# Altium schematic sheet Top Level.SchDoc
size A; SheetNumber: 1; SheetTotal: 1
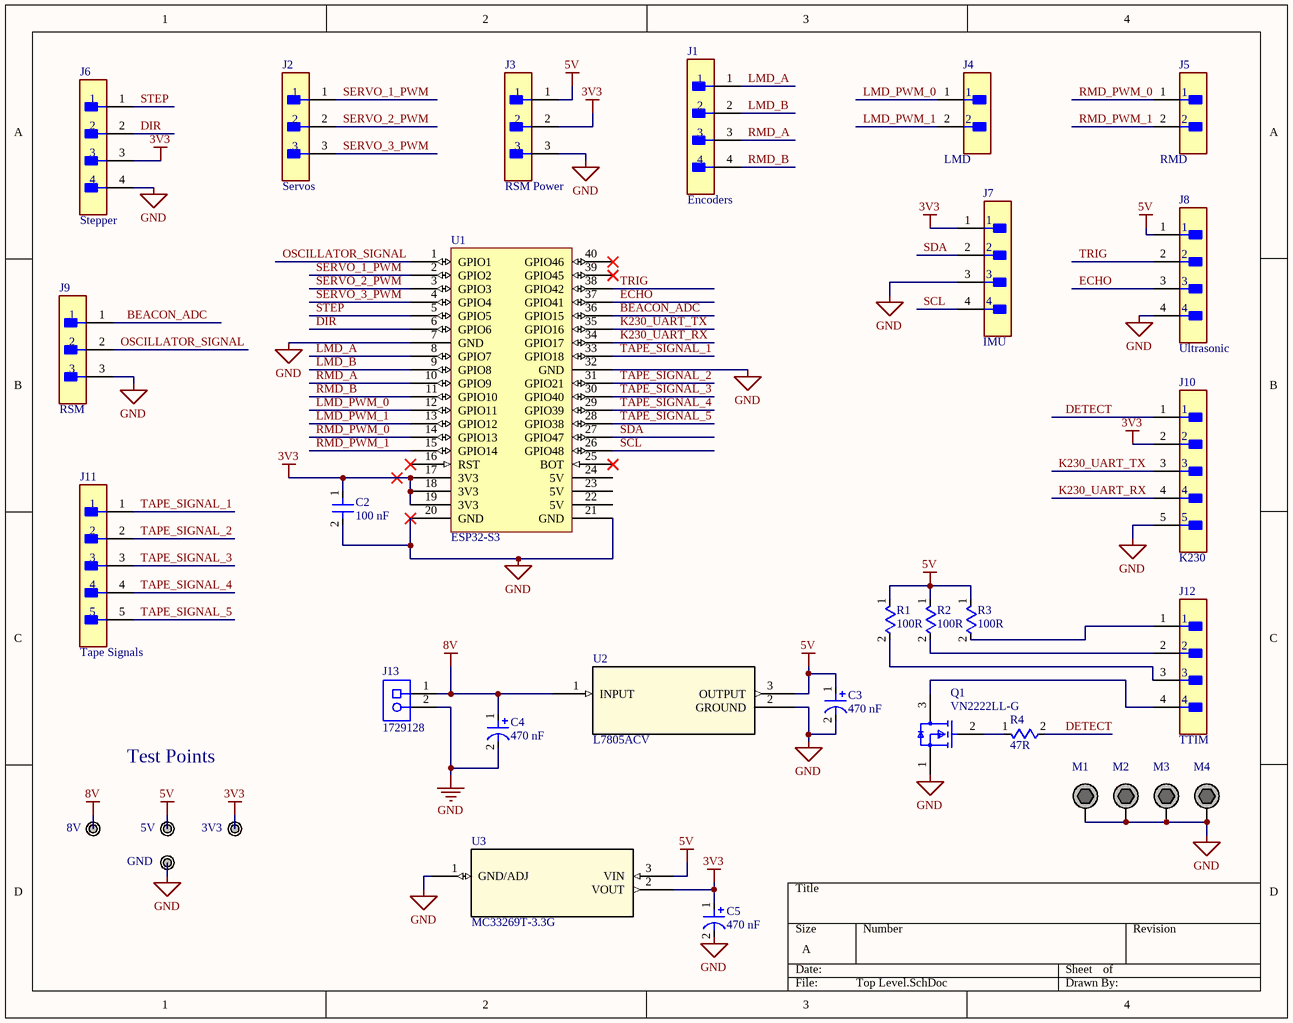
[diagram p0: Top Level.SchDoc]

## Parts
C2  100 nF  [Generic small capacitor]
C3  470 nF  [small electrolytic cap]
C4  470 nF  [small electrolytic cap]
C5  470 nF  [small electrolytic cap]
J1  Encoders  [FP-B4B-XH-A_LF_SN-MFG]
J2  Servos  [FP-B3B-XH-A_LF_SN-MFG]
J3  RSM Power  [FP-B3B-XH-A_LF_SN-MFG]
J4  LMD  [FP-B2B-XH-A_LF_SN-MFG]
J5  RMD  [FP-B2B-XH-A_LF_SN-MFG]
J6  Stepper  [FP-B4B-XH-A_LF_SN-MFG]
J7  IMU  [FP-B4B-XH-A_LF_SN-MFG]
J8  Ultrasonic  [FP-B4B-XH-A_LF_SN-MFG]
J9  RSM  [FP-B3B-XH-A_LF_SN-MFG]
J10  K230  [FP-B5B-XH-AM_LF_SN-MFG]
J11  Tape Signals  [FP-B5B-XH-AM_LF_SN-MFG]
J12  TTIM  [FP-B4B-XH-A_LF_SN-MFG]
J13  1729128  [PHOE-1729128-2_V]
M1  M3 Mounting Hole Plated  [M3 Screw Hole - Plated]  (value not drawn)  (no BOM)
M2  M3 Mounting Hole Plated  [M3 Screw Hole - Plated]  (value not drawn)  (no BOM)
M3  M3 Mounting Hole Plated  [M3 Screw Hole - Plated]  (value not drawn)  (no BOM)
M4  M3 Mounting Hole Plated  [M3 Screw Hole - Plated]  (value not drawn)  (no BOM)
Q1  VN2222LL-G  [FP-VN2222LL-G-MFG]
R1  100R  [Axial 0.5]
R2  100R  [Axial 0.5]
R3  100R  [Axial 0.5]
R4  47R  [Axial 0.5]
TP1  8V  [TESTPOINT]  (no BOM)
TP2  5V  [TESTPOINT]  (no BOM)
TP3  3V3  [TESTPOINT]  (no BOM)
TP4  GND  [TESTPOINT]  (no BOM)
U1  ESP32-S3  [esp32]
U2  L7805ACV  [TO-220_STM]
U3  MC33269T-3.3G  [MC33269T-33]

## Nets
3V3: C2.1 C5.1 J3.2 J6.3 J7.1 J10.2 TP3.1(TP) U1.17(3V3) U1.18(3V3) U1.19(3V3) U3.2(VOUT)
5V: C3.1 J3.1 J8.1 R1.1 R2.1 R3.1 TP2.1(TP) U2.3(OUTPUT) U3.3(VIN)
8V: C4.1 J13.1 TP1.1(TP) U2.1(INPUT)
GND: C2.2 C3.2 C4.2 C5.2 J3.3 J6.4 J7.3 J8.4 J9.3 J10.5 J13.2 M1.1 M2.1 M3.1 M4.1 Q1.1(SOURCE) TP4.1(TP) U1.7(GND) U1.20(GND) U1.21(GND) U1.32(GND) U2.2(GROUND) U3.1(GND/ADJ)
BEACON_ADC: J9.1 U1.36(GPIO15)
DETECT: J10.1 R4.2
DIR: J6.2 U1.6(GPIO6)
ECHO: J8.3 U1.37(GPIO41)
K230_UART_RX: J10.4 U1.34(GPIO17)
K230_UART_TX: J10.3 U1.35(GPIO16)
LMD_A: J1.1 U1.8(GPIO7)
LMD_B: J1.2 U1.9(GPIO8)
LMD_PWM_0: J4.1 U1.12(GPIO11)
LMD_PWM_1: J4.2 U1.13(GPIO12)
OSCILLATOR_SIGNAL: J9.2 U1.1(GPIO1)
RMD_A: J1.3 U1.10(GPIO9)
RMD_B: J1.4 U1.11(GPIO10)
RMD_PWM_0: J5.1 U1.14(GPIO13)
RMD_PWM_1: J5.2 U1.15(GPIO14)
SCL: J7.4 U1.26(GPIO48)
SDA: J7.2 U1.27(GPIO47)
SERVO_1_PWM: J2.1 U1.2(GPIO2)
SERVO_2_PWM: J2.2 U1.3(GPIO3)
SERVO_3_PWM: J2.3 U1.4(GPIO4)
STEP: J6.1 U1.5(GPIO5)
TAPE_SIGNAL_1: J11.1 U1.33(GPIO18)
TAPE_SIGNAL_2: J11.2 U1.31(GPIO21)
TAPE_SIGNAL_3: J11.3 U1.30(GPIO40)
TAPE_SIGNAL_4: J11.4 U1.29(GPIO39)
TAPE_SIGNAL_5: J11.5 U1.28(GPIO38)
TRIG: J8.2 U1.38(GPIO42)
NetJ12_1: J12.1 R3.2
NetJ12_2: J12.2 R2.2
NetJ12_3: J12.3 R1.2
NetJ12_4: J12.4 Q1.3(DRAIN)
NetQ1_2: Q1.2(GATE) R4.1

Not connected (* = marked no-connect by the designer): U1 16(RST)* 22(5V) 23(5V) 24(5V) 25(BOT)* 39(GPIO45)* 40(GPIO46)*

## Notes on the sheet
- Test Points

## Library data of the parts
C2 = CAP_GENERIC
C3-C5 = electrolytic cap
J1 J6-J8 J12 = CMP-17439-000250-1: CONN HEADER VERT 4POS 2.5MM; Number of Contacts: 4; Contact Resistance: 20mR; Voltage Rating: 250V; Max Current Rating: 3A; Gender: Male; Wire/Cable Gauge: 22AWG; Mated Stacking Heights: 9.8mm; Insulation Resistance: 1GR; Orientation: Straight; Contact Type: Male Pin; Contact Finish - Mating: TIN; Series: XH; Max Voltage Rating (AC): 250V; Lead Pitch: 2.5mm; Contact Shape: Square; Insulation Color: Natural; Termination: Solder; Lead Free: Lead Free; Voltage Rating (AC): 250V; Number of Rows: 1; Flammability Rating: UL94 V-0; Number of Positions: 4; Max Operating Temperature: 85°C; Package Quantity: 500; Mount: Through Hole; REACH SVHC: No SVHC; Connector Type: Header; Insulation Material: Nylon; Fastening Type: Detent; Min Operating Temperature: -25°C; Housing Color: White; Packaging: Bulk; Contact Plating: Tin; Contact Material: Brass; Max Voltage Rating (DC): 250V; Housing Material: Polyamide; Color: Natural; Material: Polyamide; Pitch: 2.5mm; Depth: 5.75mm; Current Rating: 3A; Length: 12.4mm
J2 J3 J9 = CMP-17439-000014-3: CONN HEADER VERT 3POS 2.5MM; Max Voltage Rating (DC): 250V; Number of Positions: 3; Current Rating: 3A; Gender: Male; Wire/Cable Gauge: 22AWG; Contact Resistance: 20mR; Insulation Resistance: 1GR; Insulation Material: Nylon; Contact Plating: Tin; Depth: 5.75mm; Contact Type: Male Pin; Max Operating Temperature: 85°C; Insulation Color: Natural; Voltage Rating (AC): 250V; Color: Natural; Connector Type: Header; Orientation: Straight; Fastening Type: Detent; Housing Color: White; Min Operating Temperature: -25°C; Termination: Solder; Voltage Rating: 250V; Series: XH; Pitch: 2.5mm; Contact Shape: Square; Number of Rows: 1; Lead Free: Lead Free; Packaging: Bulk; Mount: Through Hole; Flammability Rating: UL94 V-0; Max Voltage Rating (AC): 250V; REACH SVHC: No SVHC; Housing Material: Polyamide; Contact Material: Brass; Lead Pitch: 2.5mm; Contact Finish - Mating: TIN; Length: 9.9mm; Max Current Rating: 3A; Number of Contacts: 3
J4 J5 = CMP-2000-05888-3: CONN HEADER VERT 2POS 2.5MM; Current Rating: 3A; Voltage Rating: 250V; Number of Contacts: 2; Contact Resistance: 20mR; Wire/Cable Gauge: 22AWG; Insulation Resistance: 1GR; Connector Type: Male Pin; Packaging: Bulk; Contact Material: Brass; Lead Free: Lead Free; Orientation: Straight; Contact Plating: Tin; Max Current Rating: 3A; Termination: Solder; Fastening Type: Detent; Depth: 5.75mm; Housing Material: Polyamide; REACH SVHC: No SVHC; Series: XH; Voltage Rating (AC): 250V; Number of Positions: 2; Color: Natural; Contact Type: Male Pin; Max Voltage Rating (DC): 250V; Pitch: 2.5mm; Lead Pitch: 2.5mm; Mount: Through Hole; Max Operating Temperature: 85°C; Length: 7.4mm; Max Voltage Rating (AC): 250V; Min Operating Temperature: -25°C; Number of Rows: 1; Housing Color: White
J10 J11 = CMP-17439-000304-1: CONN HEADER VERT 5POS 2.5MM; Mated Stacking Heights: 9.8mm; Voltage Rating: 250V; Max Current Rating: 3A; Number of Positions: 5; Contact Resistance: 20mR; Depth: 5.75mm; Connector Type: Header; Color: Green; Insulation Material: Nylon; Contact Plating: Copper; Length: 14.9mm; Fastening Type: Detent; Contact Material: Brass; Number of Rows: 1; Contact Type: Male Pin; Housing Material: Polyamide; Housing Color: White; Lead Free: Lead Free; Max Voltage Rating (AC): 250V; Mount: Through Hole; Contact Shape: Square; Min Operating Temperature: -25°C; Packaging: Bulk; Orientation: Straight; Insulation Color: Natural; Series: XH; Flammability Rating: UL94 V-0; Contact Finish - Mating: TIN; Max Operating Temperature: 85°C; Termination: Solder; Pitch: 2.5mm
J13 = CMP-2000-05815-1: PCB Terminal Block, 13.5 A, 400 V, 2-Pin THD, RoHS, Bulk; Manufacturer: Phoenix Contact; Package Version: 03/2015; No. of Rows: 1; Pitch: 5.08mm; No. of Positions: 2; Voltage Rating: 400V; Current Rating: 13500mA; Manufacturer URL: http://www.phoenixcontact.com/; Datasheet URL: https://datasheet.ciiva.com/16046/1729128-16046181.pdf; RoHS: TRUE; Package URL: https://www.phoenixcontact.com/online/portal/pi/pxc/product_detail_page/!ut/p/b1/3VdJjqNKFDxLH8AFycySyWY2ozFsEPOMMQaDOX1XedGL_1Vdm5YXJleknhSKeBkvI6EA8ncAo3AYoDhBQGco6KN7VURTdemj9us_IEKEZo_YHiPAEWEFmDGOHMORkqKYCORBZxgL7ZoaZYcbFFUZ3fqxSY6GOuxydWUuHqz1ynmMFygu583Bob0Ewr6Sd_l-5m-kAueHiB0jpRwZwe58wwtkpxtMYd_LmGcDRU02dRNEyWt6Y2ti5pSyJ_reIkzIulrqApdnbT11V5jnCKbYNCvhEM1MCpPByat_X379-iThf08CI5GfOPqfBeS3BRoBOdD55AKVv0iLwCMq-2BrzXWSGRH7pUGD9uwXQjiph3xL0DKQwdGa0JImiIOmBNOestqgwTHSSs2oOep-78apyXQBvNi8ZLaFjvjWvcaUEBu0MC6Wbe-d6mB0FAebo2lUWinqYaZs5DAYzV0RP9yitUjnGJ0iI9xhZkT42OCQNUJJhkgWINNQLP2JFP6OpMg3JCVg70jqHT0lvKOnhHf0lPuOnnLf0VPuWx6_dxwUIvwk5WMkT0kLL1mh61l2yZVSzG3pYV_bqo-mj6uMKwKwdnnW8Jh5RTOJzMOA5c-eJDaZQw4mTMPH02PvS_ZAqNVjVTo2WyYLkwH_KU1mmmG5kjRhDqPXLwwVHvVOjCM60-fpXvTDfMGW1PVFVS1r4e4yVDk4ZdNbkUHvqPqQSeian4UD39fNKmachqdJ1NJbyk8rXT9mXTvPk3oE5meulKGgiruPJek-4I9hTT6G8ZLOyRSm2RRVbThERQad5OS28hdt4YW4vG0stgYYzsWsK4_7y6DZMjJSCqri1kyiZR5vD7pwIrNR7QwPHTcLTI5qT7eRlpHrdGiupYlqQDJ7zy_CND8fWWBoLRXxk1RVcXiBQwbTD4Xi7KL-FuO94t9xaqweXzH; PartNumber: 1729128; Package Description: 2-Pin Through Hole Device, Body 8.1 x 10.16 mm, Pitch 5.08 mm; Datasheet Version: 12/2013; Mounting Technology: ThroughHole; Orientation: Horizontal; Package Reference: 1729128-2; Packing: Bulk
M1-M4 = CMP-019-000000-3: Design Item ID: M3 Mounting Hole Plated; Source: UBC Formula Electric.SchLib
Q1 = CMP-06369-000005-1: MOSFET N-CH 60V 0.23A TO92-3; Gate to Source Voltage (Vgs): 30V; Number of Elements: 1; Continuous Drain Current (ID): 230mA; Drain to Source Resistance: 7.5R; Element Configuration: Single; Power Dissipation: 1W; Max Operating Temperature: 150°C; Mount: Through Hole; Radiation Hardening: No; Lead Free: Lead Free; Number of Pins: 3; Packaging: Bulk; Package Quantity: 1000; Min Operating Temperature: -55°C; Case/Package: TO-92; Drain to Source Breakdown Voltage: 60V
R1-R4 = RES_GENERIC
TP1-TP4 = CMP-020-0000-4: Source: UBC Formula Electric.SchLib; Design Item ID: Thru-Hole Test Point
U2 = L7805ACV: Positive voltage regulator ICs; Manufacturer_Name: STMicroelectronics; Copyright: Copyright (C) 2026 Ultra Librarian. All rights reserved.; Manufacturer_Part_Number: L7805ACV; RefDes: RefDes; Type: Type
U3 = MC33269T-3.3G: Description; Manufacturer_Name: onsemi; Copyright: Copyright (C) 2025 Ultra Librarian. All rights reserved.; Manufacturer_Part_Number: MC33269T-3.3G; RefDes: RefDes; Type: Type